# Altium schematic sheet Sheet1.SchDoc
size A4; SheetNumber: 1; SheetTotal: 2
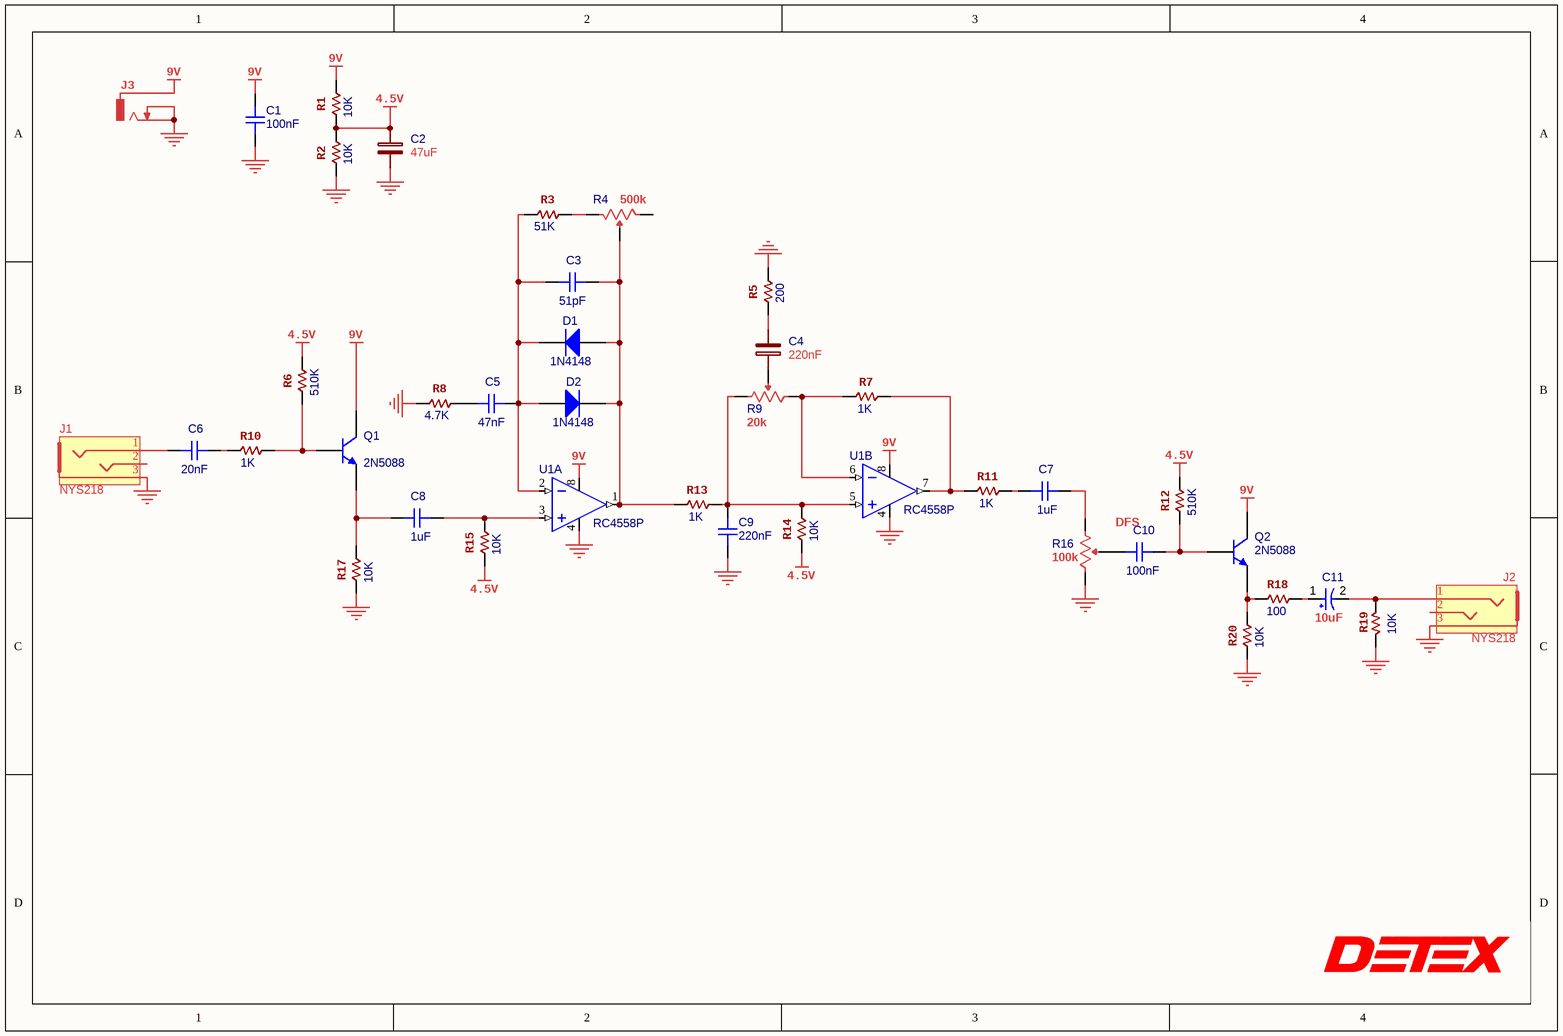
[diagram p0: Sheet1.SchDoc]

## Parts
C1  100nF  [CAP_0805]
C2  value 47uF  [FP-0805-L_2_0_0_2-W_1_25-MFG]  (hidden comment: EMK212BB7106MG-T)
C3  51pF  [CAP_0805]
C4  value 220nF  [FP-0805-L_2_0_0_2-W_1_25-MFG]  (hidden comment: EMK212BB7106MG-T)
C5  47nF  [CAP_0805]
C6  20nF  [CAP_0805]
C7  1uF  [CAP_0805]
C8  1uF  [CAP_0805]
C9  220nF  [CAP_0805]
C10  100nF  [CAP_0805]
C11  value 10uF  [CAPPR55-200-1100X500X1200]  (hidden comment: ECA-1HHG010)
D1  1N4148  [FP-017AG-MFG]
D2  1N4148  [FP-017AG-MFG]
J1  NYS218  [NYS218-Footprint-1]
J2  NYS218  [NYS218-Footprint-1]
J3  DC-005-5A-3.0  [DC-005-5A-3.0]  (value not drawn)
Q1  2N5088  [UNIC-TO-92-3]
Q2  2N5088  [UNIC-TO-92-3]
R1  10K  [RESC_M-Footprint-1]
R2  10K  [RESC_M-Footprint-1]
R3  51K  [RESC_M-Footprint-1]
R4  value 500k  [FP-B3B-XH-A_LF_SN-MFG]  (hidden comment: PDB241-GTR01-504A2)
R5  200  [RESC_M-Footprint-1]
R6  510K  [RESC_M-Footprint-1]
R7  1K  [RESC_M-Footprint-1]
R8  4.7K  [RESC_M-Footprint-1]
R9  value 20k  [FP-B3B-XH-A_LF_SN-MFG]  (hidden comment: PDB241-GTR01-504A2)
R10  1K  [RESC_M-Footprint-1]
R11  1K  [RESC_M-Footprint-1]
R12  510K  [RESC_M-Footprint-1]
R13  1K  [RESC_M-Footprint-1]
R14  10K  [RESC_M-Footprint-1]
R15  10K  [RESC_M-Footprint-1]
R16  value 100k  Case/Package: DFS  [FP-B3B-XH-A_LF_SN-MFG]  (hidden comment: PDB241-GTR01-504A2)
R17  10K  [RESC_M-Footprint-1]
R18  100  [RESC_M-Footprint-1]
R19  10K  [RESC_M-Footprint-1]
R20  10K  [RESC_M-Footprint-1]
U1  RC4558P  [P0008A]  (parts A,B of 2)

## Nets
4.5V: C2.1 R1.2 R2.1 R6.1 R12.1 R14.2 R15.2
9V: C1.2 J3.1 Q1.3(C) Q2.3(C) R1.1 U1.8(VCC+)
GND: C1.1 C2.2 C9.1 J1.3 J2.3 J3.2 J3.3 R2.2 R5.1 R8.2 R16.3 R17.2 R19.1 R20.2 U1.4(VCC-)
NetC3_1: C3.1 C5.2 D1.2(K) D2.1(A) R3.2 U1.2(IN1-)
NetC3_2: C3.2 D1.1(A) D2.2(K) R4.2 R13.2 U1.1(OUT1)
NetC4_1: C4.1 R9.2
NetC4_2: C4.2 R5.2
NetC5_1: C5.1 R8.1
NetC6_1: C6.1 J1.1
NetC6_2: C6.2 R10.2
NetC7_1: C7.1 R11.1
NetC7_2: C7.2 R16.1
NetC8_1: C8.1 Q1.2(E) R17.1
NetC8_2: C8.2 R15.1 U1.3(IN1+)
NetC9_2: C9.2 R9.1 R13.1 R14.1 U1.5(IN2+)
NetC10_1: C10.1 R16.2
NetC10_2: C10.2 Q2.1(B) R12.2
NetC11_1: C11.1 R18.1
NetC11_2: C11.2 J2.1 R19.2
NetQ1_1: Q1.1(B) R6.2 R10.1
NetQ2_2: Q2.2(E) R18.2 R20.1
NetR3_1: R3.1 R4.1
NetR7_1: R7.1 R11.2 U1.7(OUT2)
NetR7_2: R7.2 R9.3 U1.6(IN2-)

Not connected (* = marked no-connect by the designer): J1 2; J2 2; R4 3

## Notes on the sheet
- Title:
- Engineer:
- Date:
- Number:
- Time:
- Revision:
- Sheet
- of
- 302 Detex Drive
- New Braunfels, TX 78130
- (830) 629-2900
- Detex Corp <detex.com>
- File Name:

## Library data of the parts
C1 C3 C5-C10 = CMP-126-000013-1: Capacitor SMD 0805 10V; Design Item ID: CAP_0805_10V; Source: Schematic-Lib-PhilsLab.SchLib
C2 C4 = CMP-001-00093-1: Multilayer Ceramic Capacitors MLCC - SMD/SMT 10uF 16Volts X7R +/-20% 0805 STD; Tolerance: 20%; Voltage Rating: 16V; Dielectric: X7R; Case Code (Imperial): 0805
C11 = CMP-001-00024-5: Aluminum Electrolytic Capacitor, 1 uF, +/- 20%, 50 V, -55 to 105 degC, 2-Pin THD, RoHS, Bulk; Manufacturer: Panasonic; Voltage Rating: 50V; Ripple Current: 10mA; Datasheet URL: https://datasheet.ciiva.com/7275/94060-7275472.pdf; Min Operating Temperature: -55°C; Case/Package: Radial; Package Reference: CAPPR55-200-1100X500X1200; Pins: 2; Lead Pitch: 2mm; Max Operating Temperature: 105°C; Diameter: 5mm; Capacitor Type: Electrolytic; Mounting Technology: TH; Datasheet Version: Mar-05; Package Description: 2-Pin Radial Lead, Dia 5 mm, Height 12 mm; Ripple Current (AC): 10mA; RoHS Compliant: True; Packaging: Bulk; Package Quantity: 200; Manufacturer URL: http://www.panasonic.com/; Tolerance: 20%
D1 D2 = DIODE-00000-1: Rectifier Diode Single 2 EAR99 Diode Rectifier Diode 0.15A 0.004MUS 1V 150C; Max Surge Current: 4A; Forward Current: 200mA; Reverse Recovery Time: 4ns; Reverse Voltage: 100V; Power Dissipation: 500mW; Case/Package: DO-214AC; Min Operating Temperature: -55°C; Peak Non-Repetitive Surge Current: 4A; Pins: 2; Forward Voltage: 1V; Mounting Technology: Through Hole; Detex P/N: *; Max Operating Temperature: 175°C; Output Current: 200mA
J1 J2 = CONN-00000-1: Audio Conn, Stereo Jack, 3P, 6.35MM, Pcb;; Gender: Female; Number of Ports: 1; Pins: 1; Contact Material: Bronze; Mounting Technology: Through Hole; Housing Material: Polyamide; Min Operating Temperature: -20°C; Pitch: 6.35mm; Detex P/N: *; Color: Black; Contact Plating: Tin; Max Operating Temperature: 70°C
J3 = CMP-127-000017-3: DC Barrell Jack 6.2mm 5 A3.0mm Through Hole; Parameter 1: XKB; Design Item ID: DC-005-5A-3.0; Source: Schematic-Lib-PhilsLab.SchLib; Parameter 2: DC-005-5A-3.0
Q1 Q2 = TRAN-00001-1: Transistor GP BJT NPN 30V 50mA 3-Pin TO-92 Box; MFR: CENTRAL SEMICONDUCTOR; Polarity: NPN; MFR P/N: 2N5088; Transistor Type: NPN; Case/Package: TO-92; Collector Emitter Breakdown Voltage: 30V; Detex P/N: *; Pins: 3; Mounting Technology: Through Hole
R1-R3 R5-R8 R10-R15 R17-R20 = CMP-009-00178-1: 0805 SMT Resistor
R4 R9 R16 = CMP-009-00248-3: Potentiometer Carbon Guitar 500 Kohms Knurled Shaft Solderlugs PDB241-GTR Series; Number of Turns: 1; Voltage Rating: 250V; Actuator Length: 18.9992mm; Tolerance: 20%; Power Rating: 250mW; Actuator Diameter: 5.9944mm; Hole Diameter: 9.525mm; Termination: Solder; Length: 30.5mm; Diameter: 24mm; Height: 28mm; Taper: Audio; Mounting Technology: Panel; Depth: 24mm; Min Operating Temperature: -10°C; Max Operating Temperature: 70°C; Technology: Thick film
  R4 R9: Case/Package: DFS
U1 = CMP-031-00011-1: Dual, 30-V, 3-MHz, low noise (8-nV/√Hz) operational amplifier 8-PDIP 0 to 70; Gain Bandwidth Product: 3MHz; Dual Supply Voltage: 9V; Number of Circuits: 2; Min Dual Supply Voltage: 5V; Voltage Gain: 109.54dB; Input Offset Voltage (Vos): 6mV; Max Dual Supply Voltage: 15V; Common Mode Rejection Ratio: 70dB; Input Bias Current: 500nA; Width: 6.35mm; Bandwidth: 3MHz; Case/Package: PDIP; Pins: 8; Max Operating Temperature: 70°C; Length: 9.81mm; Height: 5.08mm; Max Supply Voltage: 15V; Nominal Gain Bandwidth Product: 3MHz; Min Operating Temperature: 0°C